# Altium schematic sheet DIOT_SMA_EXT.schdoc: =DocumentName
size A3; EDA_Number: DIOT; Projet: KASLI 3U subsystem; ModifiedBy: -; CreateDate: XX/XX/XXXX; CheckedDate: -; DivGrp: ISE; Designer: A.B.; DocumentNumber: 1; Revision: 0; SheetNumber: 17; SheetTotal: 17
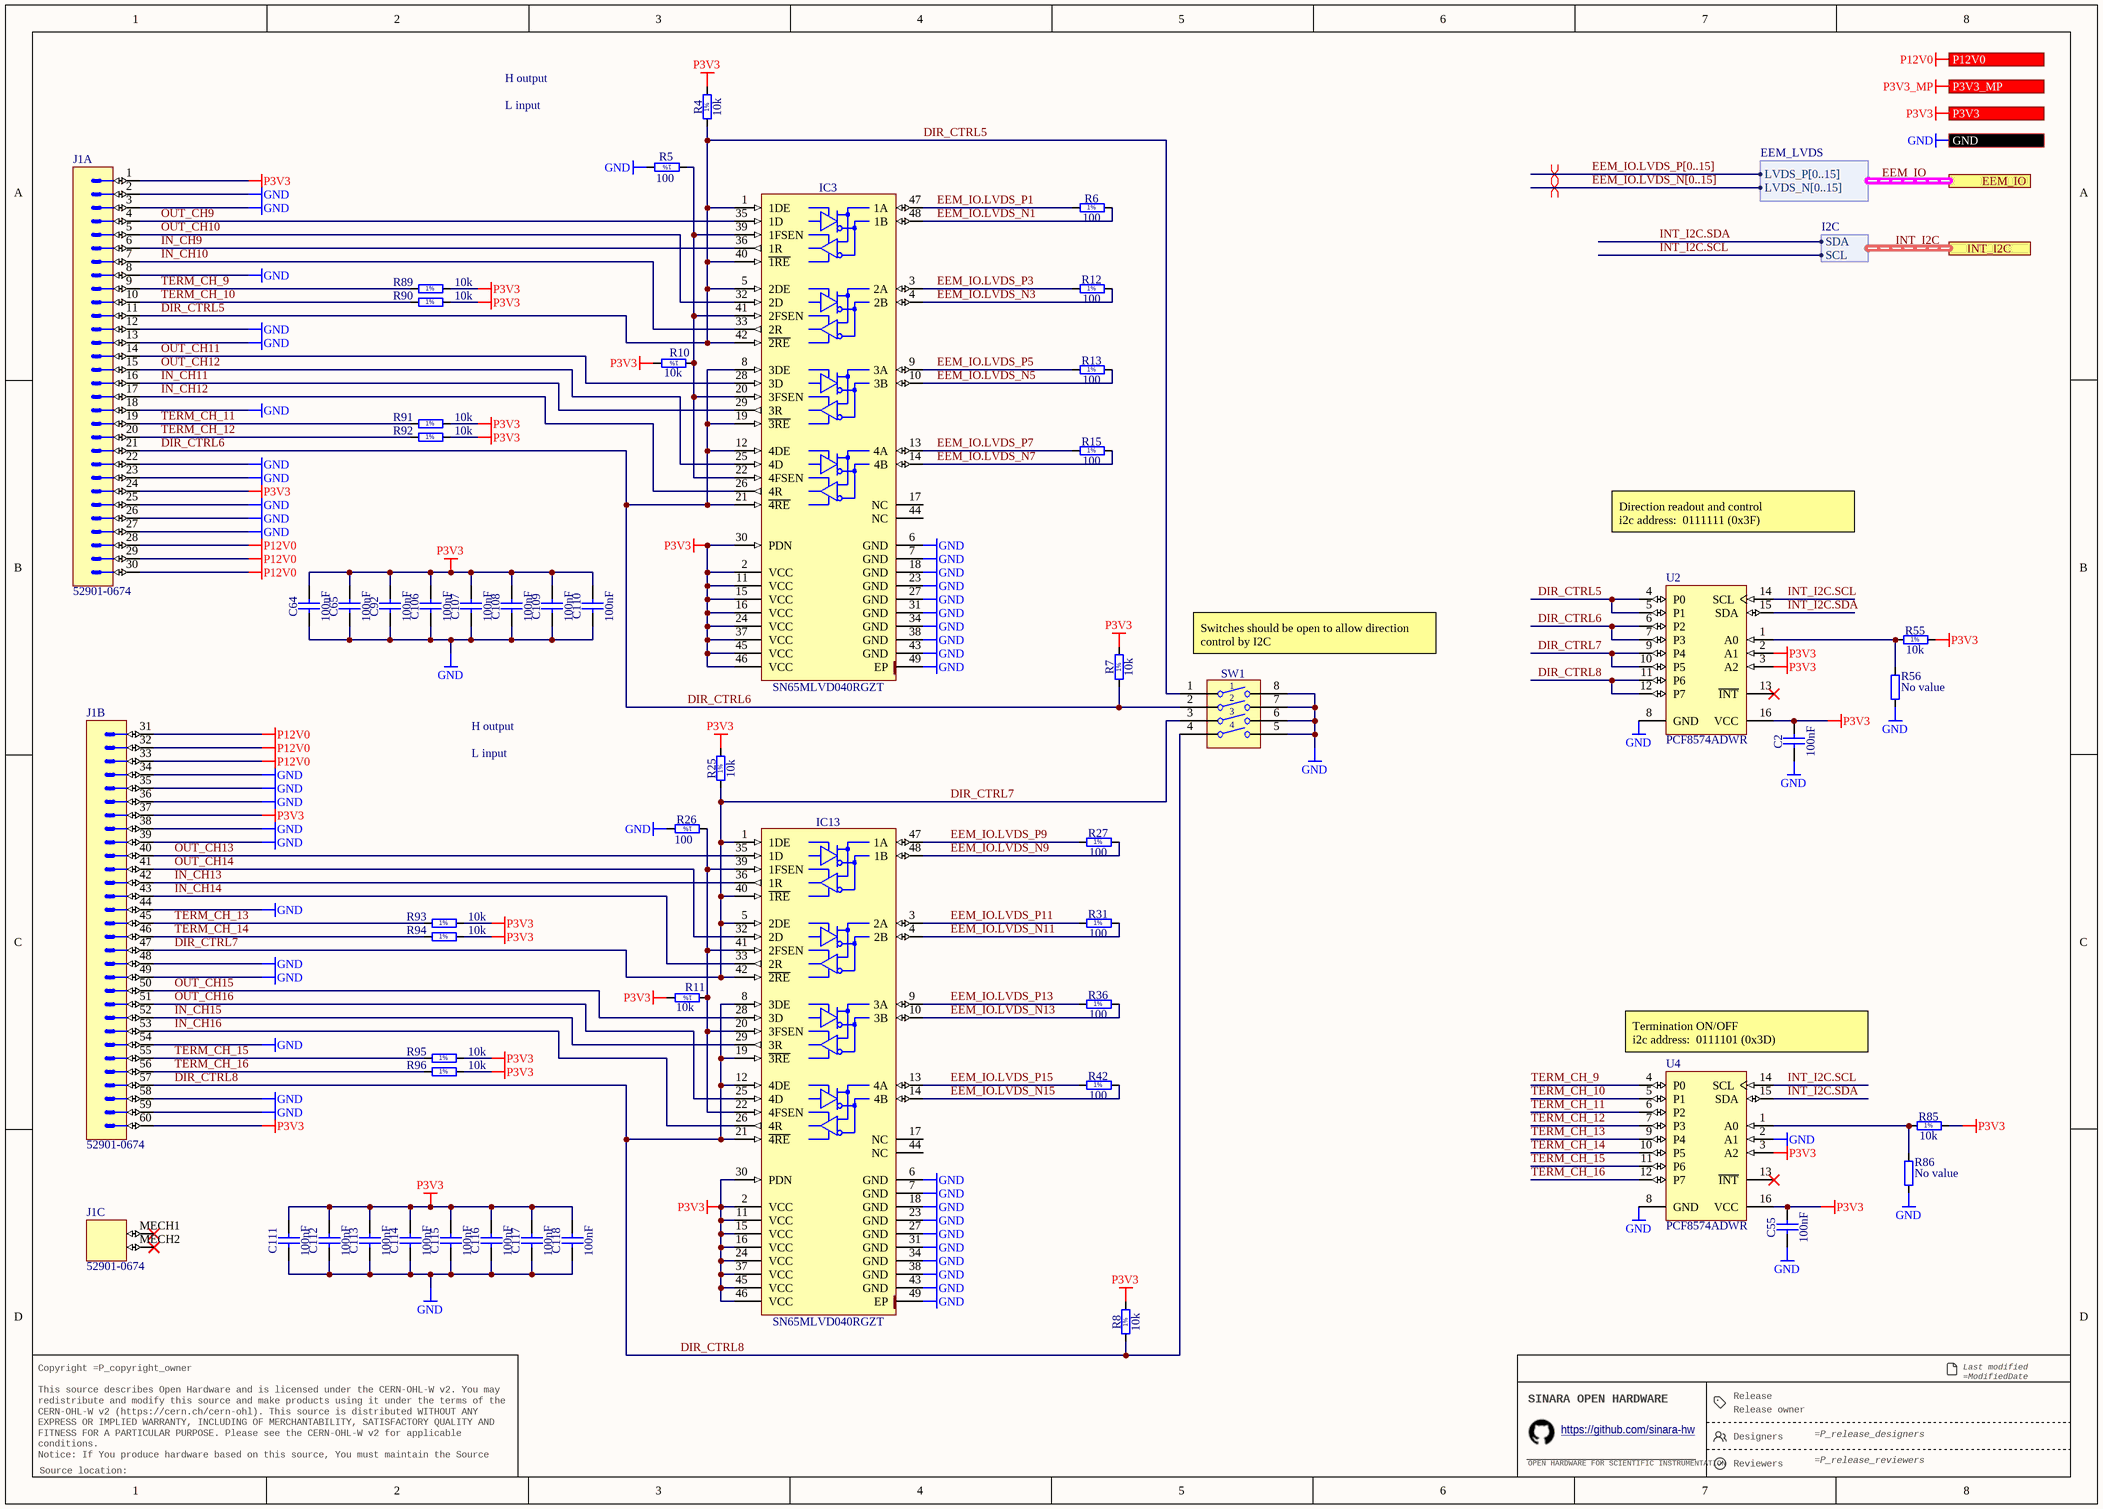
[diagram p0: DIOT_SMA_EXT.schdoc]

## Parts
C2  100nF  [CAPC1005X55N]
C55  100nF  [CAPC1005X55N]
C64  100nF  [CAPC1005X55N]
C65  100nF  [CAPC1005X55N]
C92  100nF  [CAPC1005X55N]
C106  100nF  [CAPC1005X55N]
C107  100nF  [CAPC1005X55N]
C108  100nF  [CAPC1005X55N]
C109  100nF  [CAPC1005X55N]
C110  100nF  [CAPC1005X55N]
C111  100nF  [CAPC1005X55N]
C112  100nF  [CAPC1005X55N]
C113  100nF  [CAPC1005X55N]
C114  100nF  [CAPC1005X55N]
C115  100nF  [CAPC1005X55N]
C116  100nF  [CAPC1005X55N]
C117  100nF  [CAPC1005X55N]
C118  100nF  [CAPC1005X55N]
IC3  SN65MLVD040RGZT  [QFN50P700X700X100-49N-S420]
IC13  SN65MLVD040RGZT  [QFN50P700X700X100-49N-S420]
J1  52901-0674  [FP-52901-0674-MFG]  (parts A,B,C of 3)
R4  10k  [RESC1005X40N]
R5  100  [RESC1005X40N]
R6  100  [RESC1005X40N]
R7  10k  [RESC1005X40N]
R8  10k  [RESC1005X40N]
R10  10k  [RESC1005X40N]
R11  10k  [RESC1005X40N]
R12  100  [RESC1005X40N]
R13  100  [RESC1005X40N]
R15  100  [RESC1005X40N]
R25  10k  [RESC1005X40N]
R26  100  [RESC1005X40N]
R27  100  [RESC1005X40N]
R31  100  [RESC1005X40N]
R36  100  [RESC1005X40N]
R42  100  [RESC1005X40N]
R55  10k  [RESC1005X40N]
R56  No value  [RESC1005X40N]
R85  10k  [RESC1005X40N]
R86  No value  [RESC1005X40N]
R89  10k  [RESC1005X40N]
R90  10k  [RESC1005X40N]
R91  10k  [RESC1005X40N]
R92  10k  [RESC1005X40N]
R93  10k  [RESC1005X40N]
R94  10k  [RESC1005X40N]
R95  10k  [RESC1005X40N]
R96  10k  [RESC1005X40N]
SW1  Switch  [SW_OMRON_A6S-4102-H]  (value not drawn)
U2  PCF8574ADWR  [DW0016A_M]
U4  PCF8574ADWR  [DW0016A_M]

## Ports
EEM_IO (harness EEM_LVDS), GND, INT_I2C (harness I2C), P3V3 (in), P3V3_MP (in), P12V0 (in)

## Harnesses
I2C: SDA, SCL
EEM_LVDS: LVDS_P[0..15], LVDS_N[0..15]

## Nets
GND: C2.1 C55.1 C64.1 C65.1 C92.1 C106.1 C107.1 C108.1 C109.1 C110.1 C111.1 C112.1 C113.1 C114.1 C115.1 C116.1 C117.1 C118.1 IC3.6(GND) IC3.7(GND) IC3.18(GND) IC3.23(GND) IC3.27(GND) IC3.31(GND) IC3.34(GND) IC3.38(GND) IC3.43(GND) IC3.49(EP) IC13.6(GND) IC13.7(GND) IC13.18(GND) IC13.23(GND) IC13.27(GND) IC13.31(GND) IC13.34(GND) IC13.38(GND) IC13.43(GND) IC13.49(EP) J1.2 J1.3 J1.8 J1.12 J1.13 J1.18 J1.22 J1.23 J1.25 J1.26 J1.27 J1.34 J1.35 J1.36 J1.38 J1.39 J1.44 J1.48 J1.49 J1.54 J1.58 J1.59 R5.2 R26.2 R56.1 R86.1 SW1.5 SW1.6 SW1.7 SW1.8 U2.8(GND) U4.2(A1) U4.8(GND) ; port GND
P3V3: C2.2 C55.2 C64.2 C65.2 C92.2 C106.2 C107.2 C108.2 C109.2 C110.2 C111.2 C112.2 C113.2 C114.2 C115.2 C116.2 C117.2 C118.2 IC3.2(VCC) IC3.11(VCC) IC3.15(VCC) IC3.16(VCC) IC3.24(VCC) IC3.30(PDN) IC3.37(VCC) IC3.45(VCC) IC3.46(VCC) IC13.2(VCC) IC13.11(VCC) IC13.15(VCC) IC13.16(VCC) IC13.24(VCC) IC13.30(PDN) IC13.37(VCC) IC13.45(VCC) IC13.46(VCC) J1.1 J1.24 J1.37 J1.60 R4.2 R7.2 R8.2 R10.2 R11.2 R25.2 R55.1 R85.1 R89.2 R90.2 R91.2 R92.2 R93.2 R94.2 R95.2 R96.2 U2.2(A1) U2.3(A2) U2.16(VCC) U4.3(A2) U4.16(VCC) ; port P3V3
P3V3_MP: port P3V3_MP
P12V0: J1.28 J1.29 J1.30 J1.31 J1.32 J1.33 ; port P12V0
DIR_CTRL5: IC3.1(1DE) IC3.5(2DE) IC3.40(~{1RE}) IC3.42(~{2RE}) J1.11 R4.1 SW1.1 U2.4(P0) U2.5(P1)
DIR_CTRL6: IC3.8(3DE) IC3.12(4DE) IC3.19(~{3RE}) IC3.21(~{4RE}) J1.21 R7.1 SW1.2 U2.6(P2) U2.7(P3)
DIR_CTRL7: IC13.1(1DE) IC13.5(2DE) IC13.40(~{1RE}) IC13.42(~{2RE}) J1.47 R25.1 SW1.3 U2.9(P4) U2.10(P5)
DIR_CTRL8: IC13.8(3DE) IC13.12(4DE) IC13.19(~{3RE}) IC13.21(~{4RE}) J1.57 R8.1 SW1.4 U2.11(P6) U2.12(P7)
EEM_IO.LVDS_N1: IC3.48(1B) R6.2
EEM_IO.LVDS_N3: IC3.4(2B) R12.2
EEM_IO.LVDS_N5: IC3.10(3B) R13.2
EEM_IO.LVDS_N7: IC3.14(4B) R15.2
EEM_IO.LVDS_N9: IC13.48(1B) R27.2
EEM_IO.LVDS_N11: IC13.4(2B) R31.2
EEM_IO.LVDS_N13: IC13.10(3B) R36.2
EEM_IO.LVDS_N15: IC13.14(4B) R42.2
EEM_IO.LVDS_P1: IC3.47(1A) R6.1
EEM_IO.LVDS_P3: IC3.3(2A) R12.1
EEM_IO.LVDS_P5: IC3.9(3A) R13.1
EEM_IO.LVDS_P7: IC3.13(4A) R15.1
EEM_IO.LVDS_P9: IC13.47(1A) R27.1
EEM_IO.LVDS_P11: IC13.3(2A) R31.1
EEM_IO.LVDS_P13: IC13.9(3A) R36.1
EEM_IO.LVDS_P15: IC13.13(4A) R42.1
IN_CH9: IC3.36(1R) J1.6
IN_CH10: IC3.33(2R) J1.7
IN_CH11: IC3.29(3R) J1.16
IN_CH12: IC3.26(4R) J1.17
IN_CH13: IC13.36(1R) J1.42
IN_CH14: IC13.33(2R) J1.43
IN_CH15: IC13.29(3R) J1.52
IN_CH16: IC13.26(4R) J1.53
INT_I2C.SCL: U2.14(SCL) U4.14(SCL) ; port INT_I2C.SCL
INT_I2C.SDA: U2.15(SDA) U4.15(SDA) ; port INT_I2C.SDA
OUT_CH9: IC3.35(1D) J1.4
OUT_CH10: IC3.32(2D) J1.5
OUT_CH11: IC3.28(3D) J1.14
OUT_CH12: IC3.25(4D) J1.15
OUT_CH13: IC13.35(1D) J1.40
OUT_CH14: IC13.32(2D) J1.41
OUT_CH15: IC13.28(3D) J1.50
OUT_CH16: IC13.25(4D) J1.51
TERM_CH_9: J1.9 R89.1 U4.4(P0)
TERM_CH_10: J1.10 R90.1 U4.5(P1)
TERM_CH_11: J1.19 R91.1 U4.6(P2)
TERM_CH_12: J1.20 R92.1 U4.7(P3)
TERM_CH_13: J1.45 R93.1 U4.9(P4)
TERM_CH_14: J1.46 R94.1 U4.10(P5)
TERM_CH_15: J1.55 R95.1 U4.11(P6)
TERM_CH_16: J1.56 R96.1 U4.12(P7)
NetIC3_20: IC3.20(3FSEN) IC3.22(4FSEN) IC3.39(1FSEN) IC3.41(2FSEN) R5.1 R10.1
NetIC13_20: IC13.20(3FSEN) IC13.22(4FSEN) IC13.39(1FSEN) IC13.41(2FSEN) R11.1 R26.1
NetR55_2: R55.2 R56.2 U2.1(A0)
NetR85_2: R85.2 R86.2 U4.1(A0)

Not connected (* = marked no-connect by the designer): IC3 17(NC) 44(NC); IC13 17(NC) 44(NC); J1 MECH1* MECH2*; U2 13(~{INT})*; U4 13(~{INT})*

## Buses and harness runs
bus EEM_IO.LVDS_N[0..15]
bus EEM_IO.LVDS_P[0..15]
harness EEM_IO = port EEM_IO
harness INT_I2C = port INT_I2C

## Layout directives
differential pair; differential pair class Diff_100Ohm: (no net found under the mark)

## Notes on the sheet
- H output
- L input
- Direction readout and control
  i2c address:  0111111 (0x3F)
- (near SW1) Switches should be open to allow direction control by I2C
- (near U4) Termination ON/OFF
  i2c address:  0111101 (0x3D)
- Release
- Last modified =ModifiedDate
  Sheet =sheetnumber of =sheettotal · Size A3
- Copyright =P_copyright_owner
  This source describes Open Hardware and is licensed under the CERN-OHL-W v2. You may redistribute and modify this source and make products using it under the terms of the CERN-OHL-W v2 (https://cern.ch/cern-ohl). This source is distributed WITHOUT ANY EXPRESS OR IMPLIED WARRANTY, INCLUDING OF MERCHANTABILITY, SATISFACTORY QUALITY AND FITNESS FOR A PARTICULAR PURPOSE. Please see the CERN-OHL-W v2 for applicable conditions.
  Notice: If You produce hardware based on this source, You must maintain the Source Location visible on the product, its packaging or its documentation.
- SINARA OPEN HARDWARE
- OPEN HARDWARE FOR SCIENTIFIC INSTRUMENTATION
- https://github.com/sinara-hw
- Release owner
- Designers
- Reviewers
- Source location:
- (in symbol R0402_10K_1%_0.0625W_100PPM) 1%
- (in symbol R0402_100R_1%_0.1W_100PPM) 1%

## Library data of the parts
C2 C55 C64 C65 C92 C106-C118 = CC0402_100NF_50V_10%_X7R: Non-polarised capacitor; Part Description: SMD Multilayer Chip Ceramic Capacitor; Manufacturer: GENERIC; Manufacturer1 Part Number: GRM155R71H104KE14D; Voltage: 50V; TC: X7R; Tolerance: ±10%; Part Number: CC0402_100NF_50V_10%_X7R; Component Kind: Standard; Component Type: Standard; Pin Count: 2; Value: 100nF; Status: None; Manufacturer Part Number: CC0402_100NF_50V_10%_X7R; Case: 0402; Mounted: Yes; Socket: No; SMD: Yes; Sense: No; HelpURL: \\cern.ch\dfs\Applications\Altium\Datasheets\CC0402_MURATA_GRM155R71H104KE14D.pdf; Author: CERN DEM MR; CreateDate: 30.06.2017; LatestRevisionDate: 30.06.2017; Manufacturer1 Example: MURATA; Manufacturer1 ComponentHeight: 0.55mm
IC3 IC13 = SN65MLVD040RGZT: 4-Channel Half-Duplex M-LVDS Line Transceiver; Manufacturer: TEXAS INSTRUMENTS; PressFit: No; Bonding: No; Part Number: SN65MLVD040RGZT; Component Kind: Standard; Component Type: Standard; Device: SN65MLVD040RGZT; PackageDescription: QFN, 0.50mm Pitch, Square; 48 Pin, 7.00mm L X 7.00mm W X 1mm H body (W/Thermal Tab 4.2mm X 4.2mm), IPC Medium Density; Part Description: 4-Channel Half-Duplex M-LVDS Line Transceiver; Manufacturer Part Number: SN65MLVD040RGZT; Pin Count: 49; Case: QFN48; Mounted: Yes; Socket: No; SMD: Yes; Sense: No; ComponentHeight: 1mm; Author: CERN DEM JLC; HelpURL: \\cern.ch\dfs\Applications\Altium\Datasheets\SN65MLVD040RGZT.pdf; CreateDate: 17.03.2011; LatestRevisionDate: 17.03.2011
J1 = CMP-002-04665-1: Conn Board to Board RCP 60 POS 0.635mm Solder ST SMD Embossed T/R; Manufacturer: Molex; Gender: Receptacle; Mounting Technology: Surface Mount; Min Operating Temperature: -55°C; Manufacutrer Part Number: 52901-0674; Max Operating Temperature: 105°C; Pins: 60
R4 R7 R8 R10 R11 R25 R55 R85 R89-R96 = R0402_10K_1%_0.0625W_100PPM: Resistor - 1%; Part Description: General Purpose Thick Film Chip Resistor; Manufacturer: GENERIC; Manufacturer1 Part Number: 232270671003L; TC: ±100ppm/°C; Part Number: R0402_10K_1%_0.0625W_100PPM; Component Kind: Standard; Component Type: Standard; Pin Count: 2; Value: 10k; Status: Not recommended; Power: 0.0625W; Tolerance: ±1%; Manufacturer Part Number: R0402_10K_1%_0.0625W_100PPM; Case: 0402; Mounted: Yes; Sense: No; Socket: No; SMD: Yes; Manufacturer1 Example: YAGEO PHYCOMP; Manufacturer1 ComponentHeight: 0.4mm; HelpURL: \\cern.ch\dfs\Applications\Altium\Datasheets\R0402_Phycomp_RC0402.pdf; Author: CERN DEM JLC; CreateDate: 03.12.2007; LatestRevisionDate: 17.10.2012
R5 R6 R12 R13 R15 R26 R27 R31 R36 R42 = R0402_100R_1%_0.1W_100PPM: Resistor - 1%; Part Description: General Purpose Thick Film Chip Resistor; Manufacturer: GENERIC; Manufacturer Part Number: R0402_100R_1%_0.1W_100PPM_50V; Manufacturer1 Part Number: ERJ2RKF1000X; Power: 0.1W; TC: ±100ppm/°C; Voltage: 50V; Part Number: R0402_100R_1%_0.1W_100PPM; Component Kind: Standard; Component Type: Standard; Pin Count: 2; Value: 100; Status: Not recommended; Tolerance: ±1%; Case: 0402; Mounted: Yes; Sense: No; Socket: No; SMD: Yes; Manufacturer1 Example: PANASONIC; Manufacturer1 ComponentHeight: 0.4mm; HelpURL: \\cern.ch\dfs\Applications\Altium\Datasheets\R0402_PANASONIC_ERJ2RK.pdf; Author: CERN DEM JLC; CreateDate: 12.12.2013; LatestRevisionDate: 03.03.2015
R56 R86 = R0402_0R_JUMPER: Resistor; Part Description: 1A (0.05R Max DC Resistance) Zero Ohm Jumper; Manufacturer: GENERIC; Manufacturer1 Part Number: 232270591001L; PressFit: No; Part Number: R0402_0R_JUMPER; Component Kind: Standard; Component Type: Standard; Pin Count: 2; Value: No value; Status: Not Recommended; Manufacturer Part Number: R0402_0R_JUMPER; Case: 0402; Mounted: Yes; Sense: No; Socket: No; SMD: Yes; Manufacturer1 Example: YAGEO PHYCOMP; Manufacturer1 ComponentHeight: 0.4mm; HelpURL: \\cern.ch\dfs\Applications\Altium\Datasheets\R0402_Phycomp_RC0402.pdf; Author: CERN DEM JLC; CreateDate: 03.12.2007; LatestRevisionDate: 17.10.2012
SW1 = SW_OMRON_A6S-4102-H: 4 Ways SPST DIP Switch; Part Description: 4 Ways SPST DIP Switch, White Flat Actuator with Seal Tape, Contact Rating 25mA 24VDC; Manufacturer: OMRON; PressFit: No; Part Number: SW_OMRON_A6S-4102-H; Component Kind: Standard; Component Type: Standard; Pin Count: 8; PackageDescription: Pitch 2.54mm, Body 11.3x6.4mm, 4 Ways SPST Surface-Mounting DIP Switch, OMRON A6S-H; Family: Switch; Mounted: Yes; Socket: No; SMD: Yes; Sense: No; Status: None; Manufacturer Part Number: A6S-4102-H; ComponentHeight: 3.8mm; HelpURL: \\cern.ch\dfs\Applications\Altium\Datasheets\SW_OMRON_A6S-4102-H.pdf; Author: CERN DEM JMW; CreateDate: 25.09.2008; LatestRevisionDate: 25.09.2008
U2 U4 = CMP-015-00013-1: 8-bit 2.5- to 5.5-V I2C/SMBus I/O expander with interrupt 16-SOIC -40 to 85; Manufacturer: Texas Instruments; Max Supply Voltage: 6V; Min Supply Voltage: 2.5V; Case/Package: SOIC; Manufacturer Part Number: PCF8574ADWR; Pins: 16; Min Operating Temperature: -40°C; Max Operating Temperature: 85°C